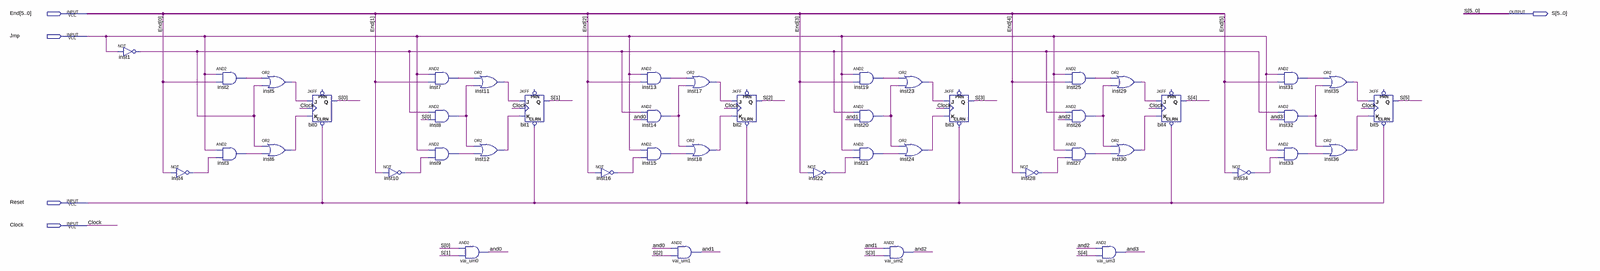
[diagram p0: schematic sheet, whole]
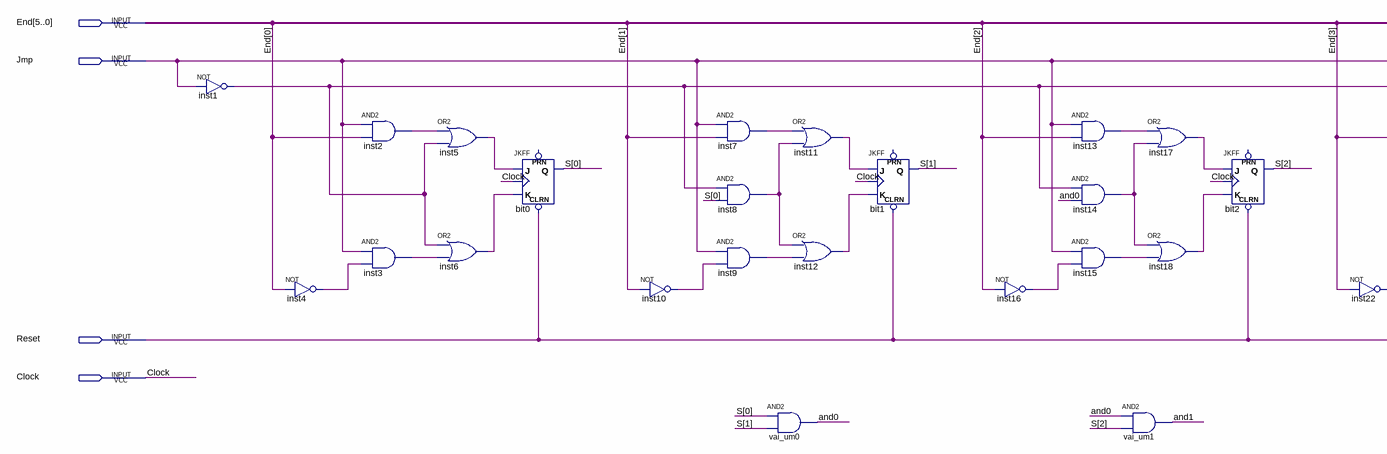
[diagram p1: schematic sheet, left part]
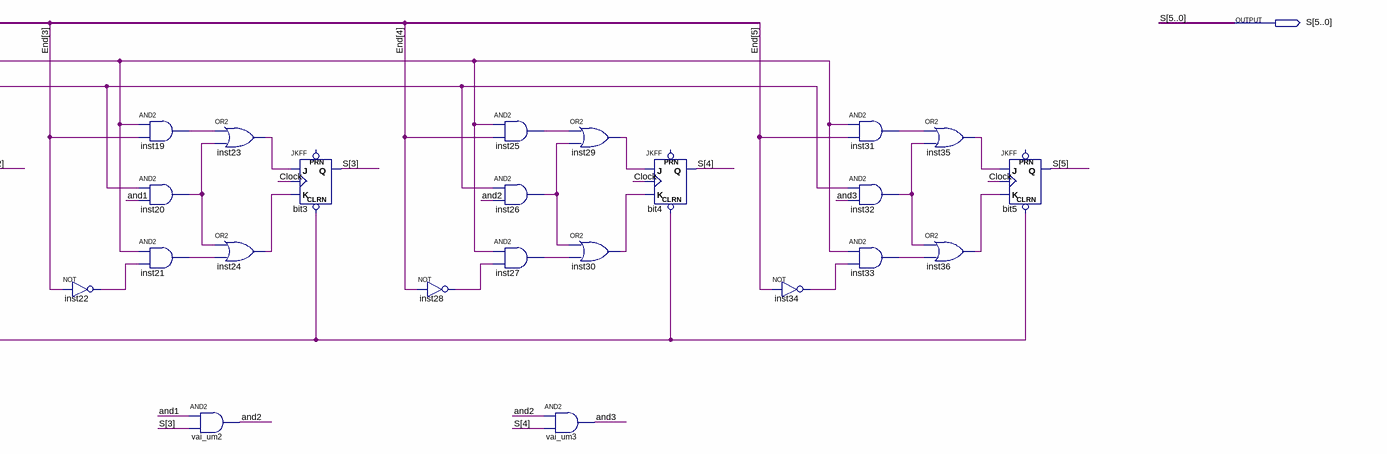
[diagram p2: schematic sheet, right part]
// Quartus schematic contadorSincrono.bdf as structural Verilog: 46 symbols, 5 pins
module contadorSincrono (
  input  [5:0] End,
  input  Jmp,
  input  Reset,
  input  Clock,
  output [5:0] S
);

  wire and0, and1, and2, and3, inst1_out, inst2_out, inst3_out, inst4_out, inst5_out, inst6_out, inst7_out,
       inst8_out, inst9_out, inst10_out, inst11_out, inst12_out, inst13_out, inst14_out, inst15_out,
       inst16_out, inst17_out, inst18_out, inst19_out, inst20_out, inst21_out, inst22_out, inst23_out,
       inst24_out, inst25_out, inst26_out, inst27_out, inst28_out, inst29_out, inst30_out, inst31_out,
       inst32_out, inst33_out, inst34_out, inst35_out, inst36_out;

  not inst1 (inst1_out, Jmp);
  not inst4 (inst4_out, End[0]);
  and inst2 (inst2_out, Jmp, End[0]);
  and inst3 (inst3_out, Jmp, inst4_out);
  or inst5 (inst5_out, inst2_out, inst1_out);
  or inst6 (inst6_out, inst1_out, inst3_out);
  JKFF bit0 (.CLRN(Reset), .K(inst6_out), .J(inst5_out), .CLK(Clock), .Q(S[0]));  // open: PRN
  not inst10 (inst10_out, End[1]);
  and inst7 (inst7_out, Jmp, End[1]);
  and inst8 (inst8_out, inst1_out, S[0]);
  and inst9 (inst9_out, Jmp, inst10_out);
  or inst11 (inst11_out, inst7_out, inst8_out);
  or inst12 (inst12_out, inst8_out, inst9_out);
  and vai_um0 (and0, S[0], S[1]);
  JKFF bit1 (.CLRN(Reset), .K(inst12_out), .J(inst11_out), .CLK(Clock), .Q(S[1]));  // open: PRN
  not inst16 (inst16_out, End[2]);
  and inst13 (inst13_out, Jmp, End[2]);
  and inst14 (inst14_out, inst1_out, and0);
  and inst15 (inst15_out, Jmp, inst16_out);
  or inst17 (inst17_out, inst13_out, inst14_out);
  or inst18 (inst18_out, inst14_out, inst15_out);
  and vai_um1 (and1, and0, S[2]);
  JKFF bit2 (.CLRN(Reset), .K(inst18_out), .J(inst17_out), .CLK(Clock), .Q(S[2]));  // open: PRN
  not inst22 (inst22_out, End[3]);
  and inst19 (inst19_out, Jmp, End[3]);
  and inst20 (inst20_out, inst1_out, and1);
  and inst21 (inst21_out, Jmp, inst22_out);
  or inst23 (inst23_out, inst19_out, inst20_out);
  or inst24 (inst24_out, inst20_out, inst21_out);
  and vai_um2 (and2, and1, S[3]);
  JKFF bit3 (.CLRN(Reset), .K(inst24_out), .J(inst23_out), .CLK(Clock), .Q(S[3]));  // open: PRN
  not inst28 (inst28_out, End[4]);
  and inst25 (inst25_out, Jmp, End[4]);
  and inst26 (inst26_out, inst1_out, and2);
  and inst27 (inst27_out, Jmp, inst28_out);
  or inst29 (inst29_out, inst25_out, inst26_out);
  or inst30 (inst30_out, inst26_out, inst27_out);
  and vai_um3 (and3, and2, S[4]);
  JKFF bit4 (.CLRN(Reset), .K(inst30_out), .J(inst29_out), .CLK(Clock), .Q(S[4]));  // open: PRN
  not inst34 (inst34_out, End[5]);
  and inst31 (inst31_out, Jmp, End[5]);
  and inst32 (inst32_out, inst1_out, and3);
  and inst33 (inst33_out, Jmp, inst34_out);
  or inst35 (inst35_out, inst31_out, inst32_out);
  or inst36 (inst36_out, inst32_out, inst33_out);
  JKFF bit5 (.CLRN(Reset), .K(inst36_out), .J(inst35_out), .CLK(Clock), .Q(S[5]));  // open: PRN
endmodule
